# Altium schematic sheet x-IMU3-SA-Sync.SchDoc
size A4; SheetNumber: 1; SheetTotal: 1
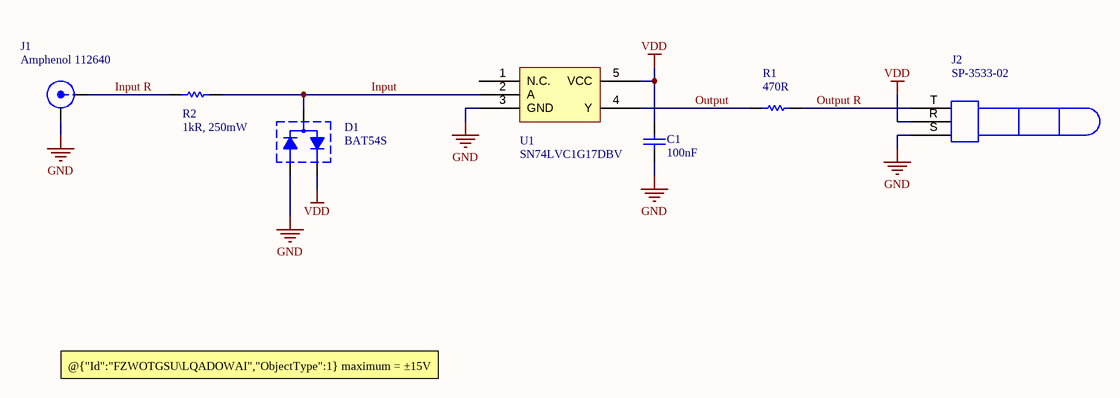
[diagram p0: x-IMU3-SA-Sync.SchDoc]

## Parts
C1  100nF  [Capacitor 0402]
D1  BAT54S  [SOT-23]
J1  Amphenol 112640  [Amphenol 112640]
J2  SP-3533-02  [SP-3533-02]
R1  470R  [Resistor 0402]
R2  1kR, 250mW  [Resistor 1206]
U1  SN74LVC1G17DBV  [SOT-23-5]

## Nets
GND: C1.1 D1.1(A1) J1.Shield J2.S U1.3(GND)
VDD: C1.2 D1.2(K2) J2.R U1.5(VCC)
Input: D1.3(K1/A2) R2.2 U1.2(A)
Input R: J1.Signal R2.1
Output: R1.1 U1.4(Y)
Output R: J2.T R1.2

Not connected (* = marked no-connect by the designer): U1 1(N.C.)

## Notes on the sheet
- @{"Id":"FZWOTGSU\LQADOWAI","ObjectType":1} maximum = ±15V DC (limited by @{"Id":"FZWOTGSU\OLVLVNNB","ObjectType":2} 250mW dissipation)
- TITLE
- SIZE
- A4
- VARIANT
- PROJECT
- SHEET
- VERSION
- OF
- AUTHOR
- DATE

## Library data of the parts
C1 = Capacitor
J1 = BNC
R1 R2 = Resistor
U1 = SN74LVC1xxx (1 Input)